# Altium schematic sheet 23_Radar_bypass.SchDoc
size 289 x 400 mm
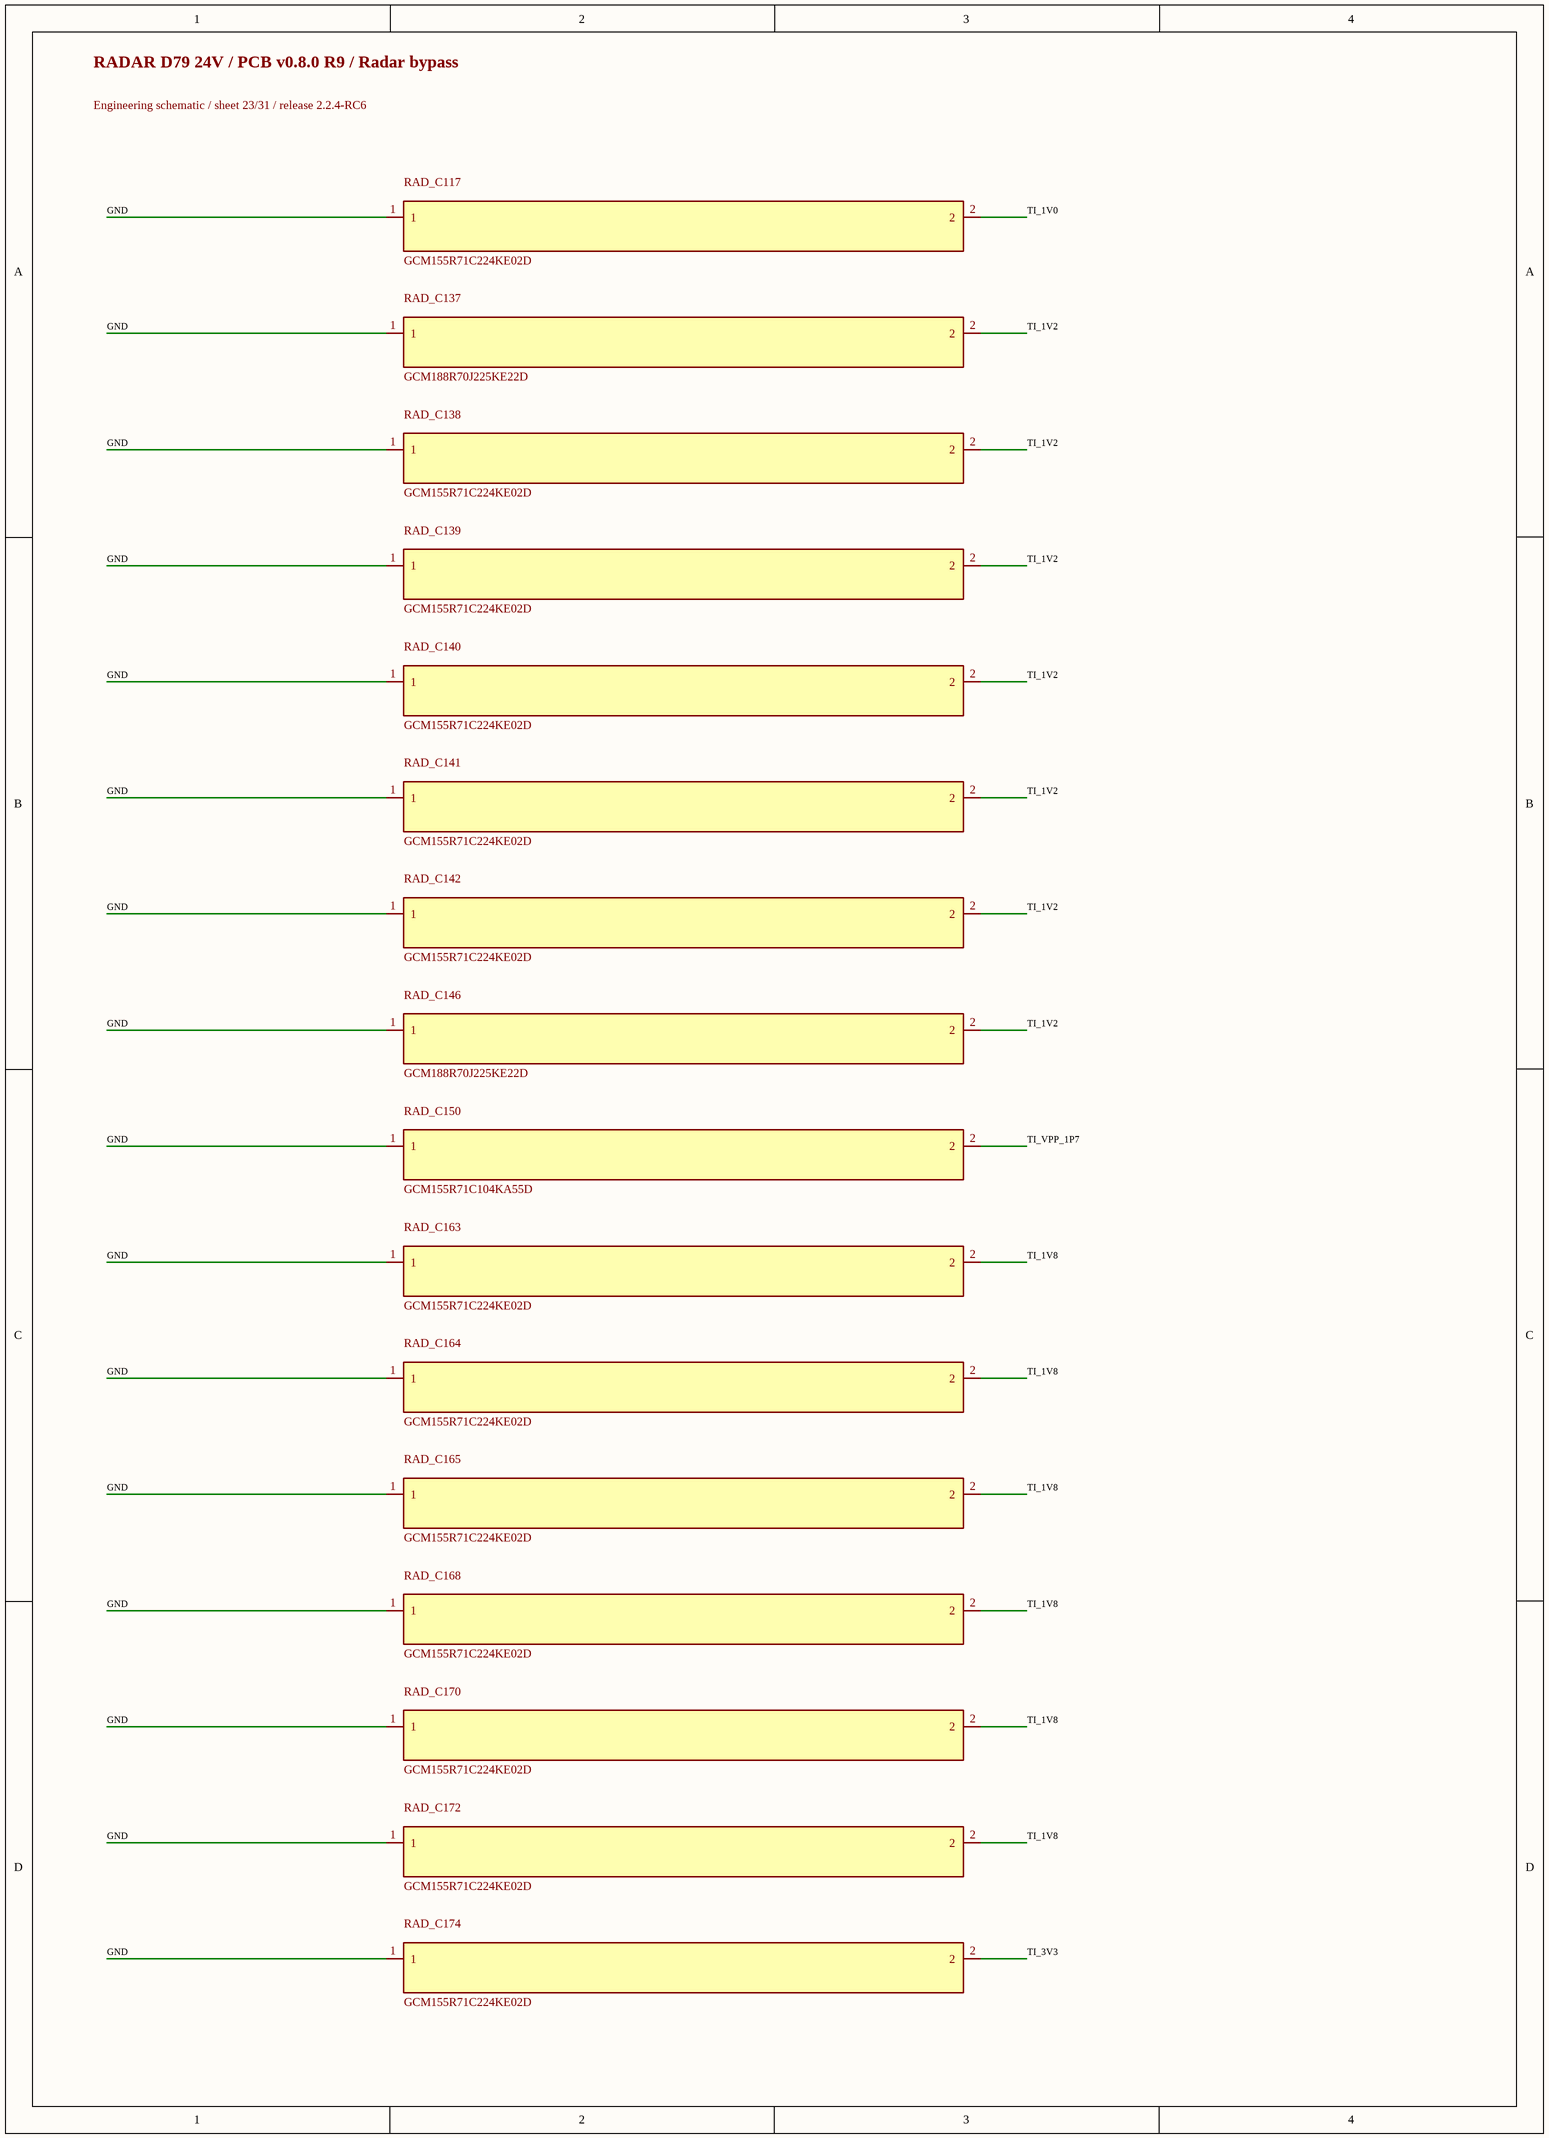
[diagram p0: 23_Radar_bypass.SchDoc]

## Parts
RAD_C117  GCM155R71C224KE02D  [0402L]
RAD_C137  GCM188R70J225KE22D  [0603L]
RAD_C138  GCM155R71C224KE02D  [0402L]
RAD_C139  GCM155R71C224KE02D  [0402L]
RAD_C140  GCM155R71C224KE02D  [0402L]
RAD_C141  GCM155R71C224KE02D  [0402L]
RAD_C142  GCM155R71C224KE02D  [0402L]
RAD_C146  GCM188R70J225KE22D  [0603L]
RAD_C150  GCM155R71C104KA55D  [0402L]
RAD_C163  GCM155R71C224KE02D  [0402L]
RAD_C164  GCM155R71C224KE02D  [0402L]
RAD_C165  GCM155R71C224KE02D  [0402L]
RAD_C168  GCM155R71C224KE02D  [0402L]
RAD_C170  GCM155R71C224KE02D  [0402L]
RAD_C172  GCM155R71C224KE02D  [0402L]
RAD_C174  GCM155R71C224KE02D  [0402L]

## Nets
GND: RAD_C117.1 RAD_C137.1 RAD_C138.1 RAD_C139.1 RAD_C140.1 RAD_C141.1 RAD_C142.1 RAD_C146.1 RAD_C150.1 RAD_C163.1 RAD_C164.1 RAD_C165.1 RAD_C168.1 RAD_C170.1 RAD_C172.1 RAD_C174.1
TI_1V0: RAD_C117.2
TI_1V2: RAD_C137.2 RAD_C138.2 RAD_C139.2 RAD_C140.2 RAD_C141.2 RAD_C142.2 RAD_C146.2
TI_1V8: RAD_C163.2 RAD_C164.2 RAD_C165.2 RAD_C168.2 RAD_C170.2 RAD_C172.2
TI_3V3: RAD_C174.2
TI_VPP_1P7: RAD_C150.2

## Notes on the sheet
- RADAR D79 24V / PCB v0.8.0 R9 / Radar bypass
- Engineering schematic / sheet 23/31 / release 2.2.4-RC6